# Altium schematic sheet SheetPowr.SchDoc: ?
size A3; Organization: VGTU; Address1: Elektronikos fakultetas; Address2: Kompiuterių inžinerijos katedra; Address3: Naugarduko 41; Address4: Vilnius, Lietuva; Revision: ?; SheetNumber: ?; SheetTotal: ?
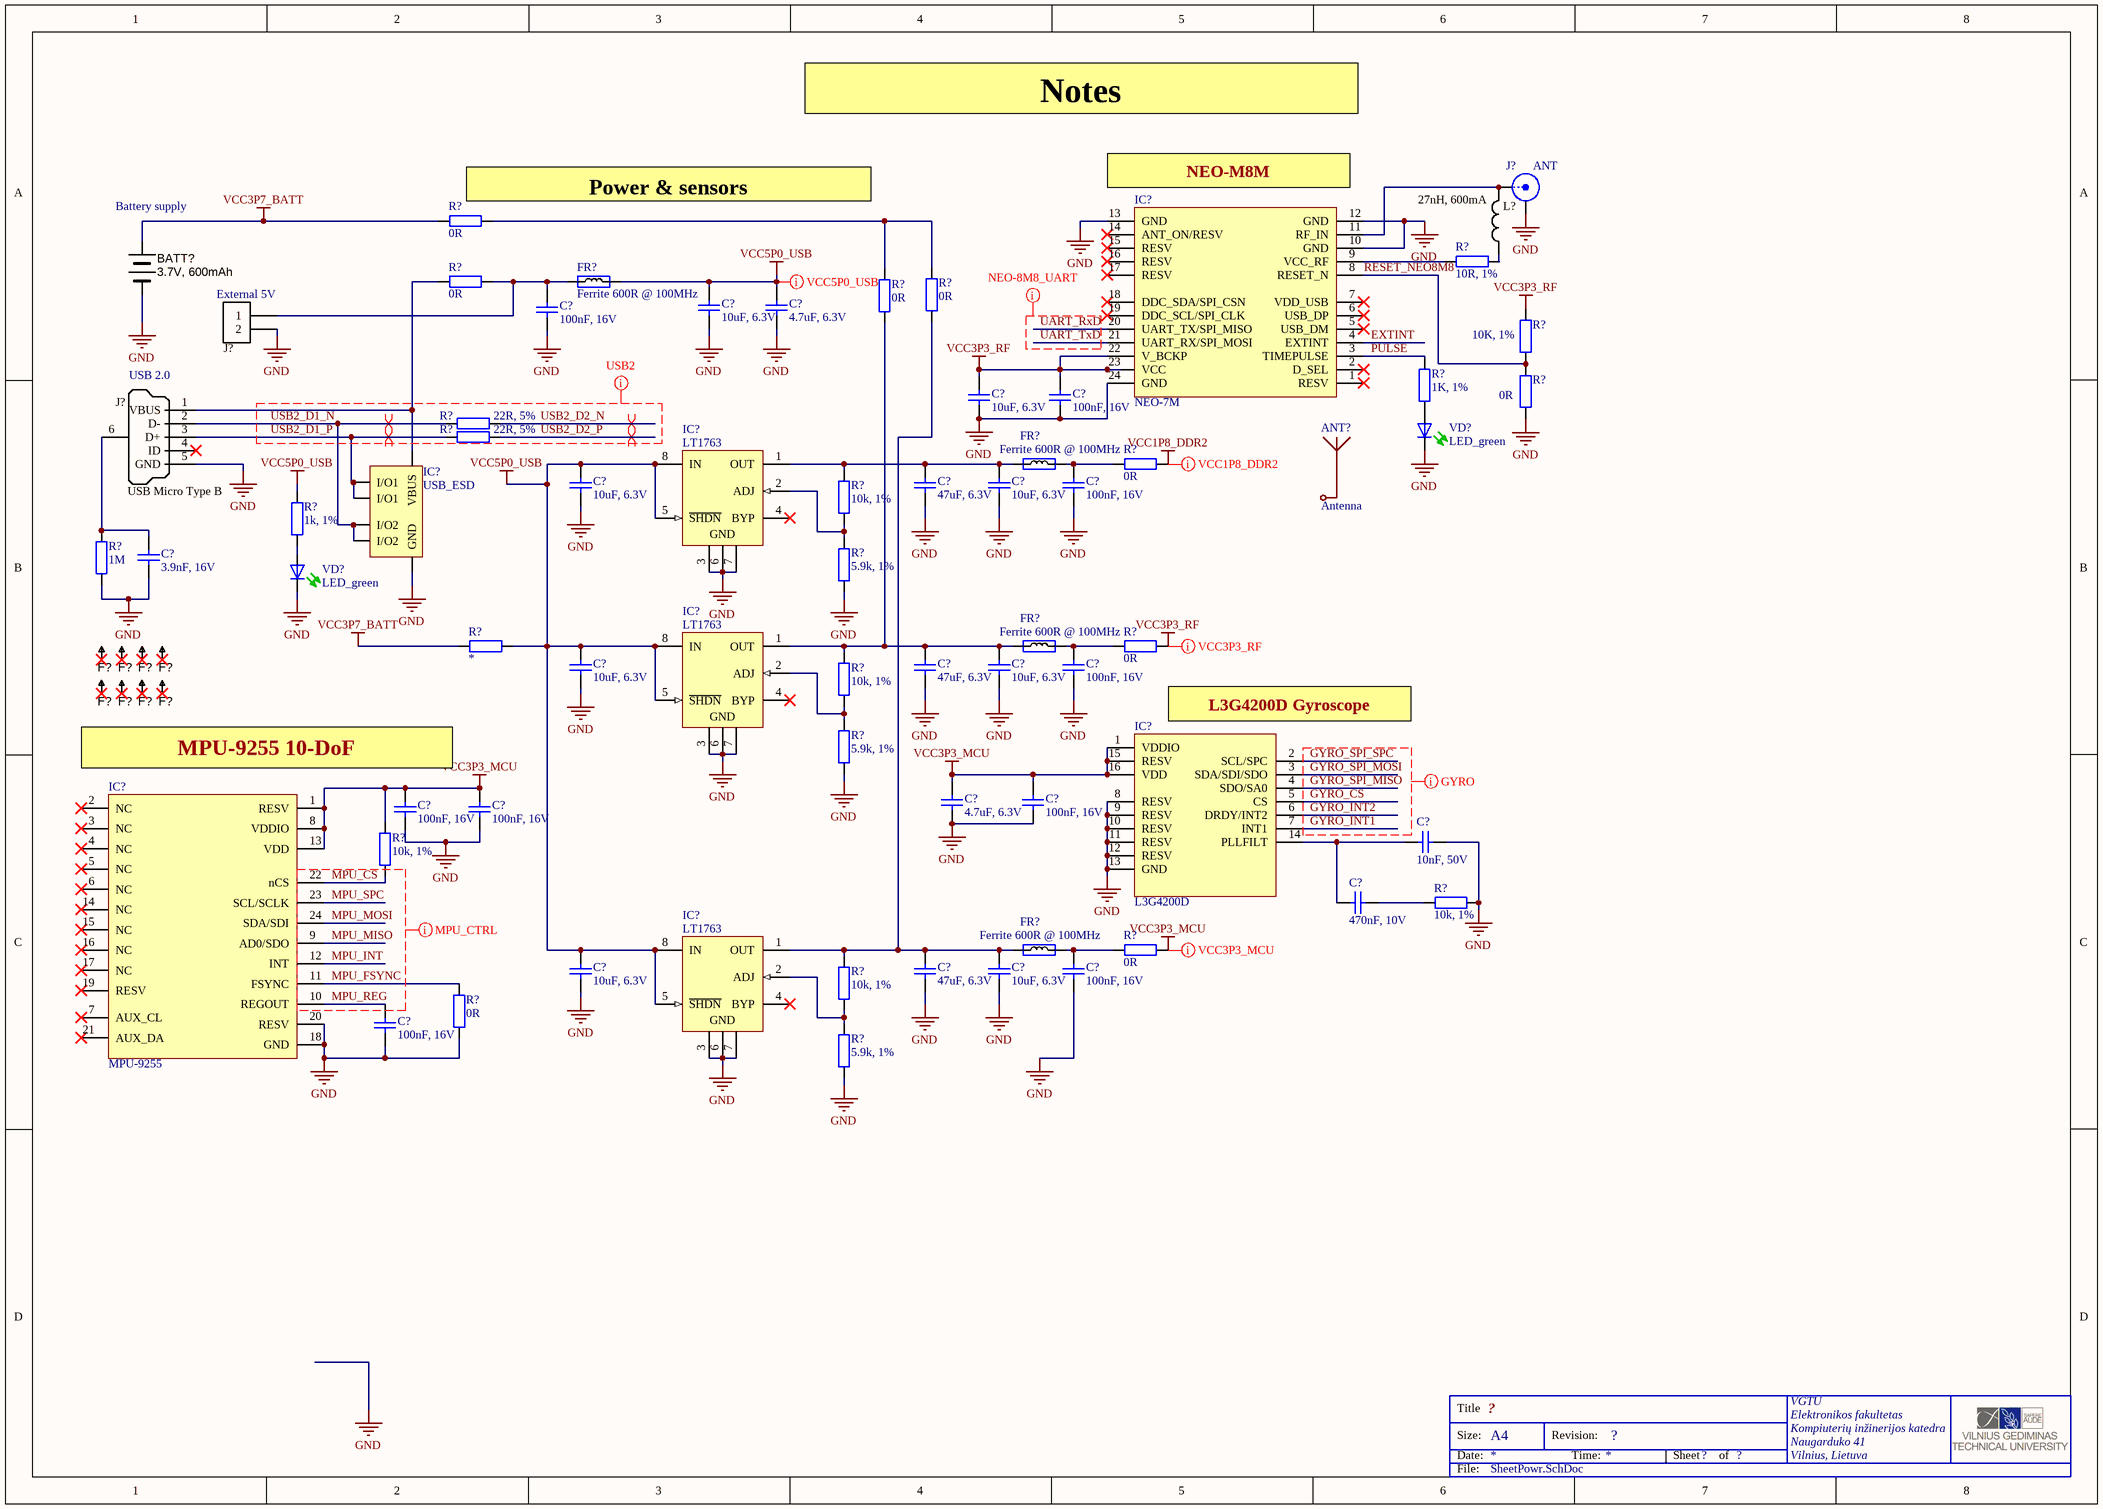
[diagram p0: SheetPowr.SchDoc]

## Parts
(Parts that share a designator on the sheet are numbered #1, #2 ... from top to bottom, then left to right.)
ANT?  Antenna  (mechanical)
BATT?  3.7V, 600mAh  (no BOM)
C?#1  100nF, 16V  [CAP0402]
C?#2  10uF, 6.3V  [CAP0402]
C?#3  4.7uF, 6.3V  [CAP0402]
C?#4  10uF, 6.3V  [CAP0402]
C?#5  100nF, 16V  [CAP0402]
C?#6  10uF, 6.3V  [CAP0402]
C?#7  47uF, 6.3V  [CAP0402]
C?#8  10uF, 6.3V  [CAP0402]
C?#9  100nF, 16V  [CAP0402]
C?#10  3.9nF, 16V  [CAP0402]
C?#11  10uF, 6.3V  [CAP0402]
C?#12  47uF, 6.3V  [CAP0402]
C?#13  10uF, 6.3V  [CAP0402]
C?#14  100nF, 16V  [CAP0402]
C?#15  4.7uF, 6.3V  [CAP0402]
C?#16  100nF, 16V  [CAP0402]
C?#17  100nF, 16V  [CAP0402]
C?#18  100nF, 16V  [CAP0402]
C?#19  10nF, 50V  [CAP0402]
C?#20  470nF, 10V  [CAP0402]
C?#21  10uF, 6.3V  [CAP0402]
C?#22  47uF, 6.3V  [CAP0402]
C?#23  10uF, 6.3V  [CAP0402]
C?#24  100nF, 16V  [CAP0402]
C?#25  100nF, 16V  [CAP0402]
F?#1  Fiducial  [Fiducial]  (value not drawn)  (no BOM)
F?#2  Fiducial  [Fiducial]  (value not drawn)  (no BOM)
F?#3  Fiducial  [Fiducial]  (value not drawn)  (no BOM)
F?#4  Fiducial  [Fiducial]  (value not drawn)  (no BOM)
F?#5  Fiducial  [Fiducial]  (value not drawn)  (no BOM)
F?#6  Fiducial  [Fiducial]  (value not drawn)  (no BOM)
F?#7  Fiducial  [Fiducial]  (value not drawn)  (no BOM)
F?#8  Fiducial  [Fiducial]  (value not drawn)  (no BOM)
FR?#1  Ferrite 600R @ 100MHz  [RES0402]
FR?#2  Ferrite 600R @ 100MHz  [RES0402]
FR?#3  Ferrite 600R @ 100MHz  [RES0402]
FR?#4  Ferrite 600R @ 100MHz  [RES0402]
IC?#1  NEO-7M
IC?#2  LT1763  [LT-S8-8_M]
IC?#3  USB_ESD  [USBULC6]
IC?#4  LT1763  [LT-S8-8_M]
IC?#5  L3G4200D
IC?#6  MPU-9255
IC?#7  LT1763  [LT-S8-8_M]
J?#1  ANT  [MMCX_conn]
J?#2  Header 2x1 pin  (value not drawn)
J?#3  USB Micro Type B  [microUSB]
L?  27nH, 600mA
R?#1  0R  [RES0402]
R?#2  10R, 1%  [RES0402]
R?#3  0R  [RES0402]
R?#4  0R  [RES0402]
R?#5  0R  [RES0402]
R?#6  10K, 1%  [RES0402]
R?#7  1K, 1%  [RES0402]
R?#8  0R  [RES0402]
R?#9  22R, 5%  [RES0402]
R?#10  22R, 5%  [RES0402]
R?#11  0R  [RES0402]
R?#12  10k, 1%  [RES0402]
R?#13  1k, 1%  [RES0402]
R?#14  1M  [RES0402]
R?#15  5.9k, 1%  [RES0402]
R?#16  *  [RES0402]
R?#17  0R  [RES0402]
R?#18  10k, 1%  [RES0402]
R?#19  5.9k, 1%  [RES0402]
R?#20  10k, 1%  [RES0402]
R?#21  10k, 1%  [RES0402]
R?#22  0R  [RES0402]
R?#23  10k, 1%  [RES0402]
R?#24  0R  [RES0402]
R?#25  5.9k, 1%  [RES0402]
VD?#1  LED_green  [LED-0603-GREEN]
VD?#2  LED_green  [LED-0603-GREEN]

## Nets
GND: BATT?.2 C?#1.1 C?#2.1 C?#3.1 C?#4.1 C?#5.1 C?#6.1 C?#7.1 C?#8.1 C?#9.1 C?#10.1 C?#11.1 C?#12.1 C?#13.1 C?#14.1 C?#15.1 C?#16.1 C?#17.2 C?#18.2 C?#19.1 C?#21.1 C?#22.1 C?#23.1 C?#24.1 C?#25.2 IC?#1.10(GND) IC?#1.12(GND) IC?#1.13(GND) IC?#1.24(GND) IC?#2.3(GND) IC?#2.6(GND) IC?#2.7(GND) IC?#3.2(GND) IC?#4.3(GND) IC?#4.6(GND) IC?#4.7(GND) IC?#5.8(RESV) IC?#5.9(RESV) IC?#5.10(RESV) IC?#5.11(RESV) IC?#5.12(RESV) IC?#5.13(GND) IC?#6.18(GND) IC?#6.20(RESV) IC?#7.3(GND) IC?#7.6(GND) IC?#7.7(GND) J?#1.2(Y) J?#2.2 J?#3.5(GND) R?#8.2 R?#14.1 R?#15.1 R?#19.1 R?#21.1 R?#24.2 R?#25.1 VD?#1.K(C) VD?#2.K(C)
VCC1P8_DDR2: R?#11.1
VCC3P3_MCU: C?#15.2 C?#16.2 C?#17.1 C?#18.1 IC?#5.1(VDDIO) IC?#5.15(RESV) IC?#5.16(VDD) IC?#6.1(RESV) IC?#6.8(VDDIO) IC?#6.13(VDD) R?#20.1 R?#22.1
VCC3P3_RF: C?#4.2 C?#5.2 IC?#1.22(V_BCKP) IC?#1.23(VCC) R?#6.2 R?#17.1
VCC3P7_BATT: BATT?.1 R?#1.1 R?#16.1
VCC5P0_USB: C?#2.2 C?#3.2 C?#6.2 C?#11.2 C?#21.2 FR?#1.2 IC?#2.5(~{SHDN}) IC?#2.8(IN) IC?#4.5(~{SHDN}) IC?#4.8(IN) IC?#7.5(~{SHDN}) IC?#7.8(IN) R?#13.2 R?#16.2
EXTINT: IC?#1.4(EXTINT)
GYRO_CS: IC?#5.5(CS)
GYRO_INT1: IC?#5.7(INT1)
GYRO_INT2: IC?#5.6(DRDY/INT2)
GYRO_SPI_MISO: IC?#5.4(SDO/SA0)
GYRO_SPI_MOSI: IC?#5.3(SDA/SDI/SDO)
GYRO_SPI_SPC: IC?#5.2(SCL/SPC)
MPU_CS: IC?#6.22(nCS) R?#20.2
MPU_FSYNC: IC?#6.11(FSYNC) R?#24.1
MPU_INT: IC?#6.12(INT)
MPU_MISO: IC?#6.9(AD0/SDO)
MPU_MOSI: IC?#6.24(SDA/SDI)
MPU_REG: C?#25.1 IC?#6.10(REGOUT)
MPU_SPC: IC?#6.23(SCL/SCLK)
PULSE: IC?#1.3(TIMEPULSE) R?#7.2
RESET_NEO8M8: IC?#1.8(RESET_N) R?#6.1 R?#8.1
UART_RxD: IC?#1.20(UART_TX/SPI_MISO)
UART_TxD: IC?#1.21(UART_RX/SPI_MOSI)
USB2_D1_N: IC?#3.3(I/O2) IC?#3.4(I/O2) J?#3.2(D-) R?#9.1
USB2_D1_P: IC?#3.1(I/O1) IC?#3.6(I/O1) J?#3.3(D+) R?#10.1
USB2_D2_N: R?#9.2
USB2_D2_P: R?#10.2
NetC?#1_2: C?#1.2 FR?#1.1 J?#2.1 R?#3.2
NetC?#7_2: C?#7.2 C?#8.2 FR?#2.1 IC?#2.1(OUT) R?#12.2
NetC?#9_2: C?#9.2 FR?#2.2 R?#11.2
NetC?#10_2: C?#10.2 J?#3.6(Shell) R?#14.2
NetC?#12_2: C?#12.2 C?#13.2 FR?#3.1 IC?#4.1(OUT) R?#4.1 R?#18.2
NetC?#14_2: C?#14.2 FR?#3.2 R?#17.2
NetC?#19_2: C?#19.2 C?#20.2 IC?#5.14(PLLFILT)
NetC?#20_1: C?#20.1 R?#21.2
NetC?#22_2: C?#22.2 C?#23.2 FR?#4.1 IC?#7.1(OUT) R?#5.1 R?#23.2
NetC?#24_2: C?#24.2 FR?#4.2 R?#22.2
NetIC?#1_9: IC?#1.9(VCC_RF) R?#2.1
NetIC?#1_11: IC?#1.11(RF_IN) J?#1.1(X) L?.2
NetIC?#2_2: IC?#2.2(ADJ) R?#12.1 R?#15.2
NetIC?#3_5: IC?#3.5(VBUS) J?#3.1(VBUS) R?#3.1
NetIC?#4_2: IC?#4.2(ADJ) R?#18.1 R?#19.2
NetIC?#7_2: IC?#7.2(ADJ) R?#23.1 R?#25.2
NetL?_1: L?.1 R?#2.2
NetR?#1_2: R?#1.2 R?#4.2 R?#5.2
NetR?#7_1: R?#7.1 VD?#1.A
NetR?#13_1: R?#13.1 VD?#2.A

Not connected (* = marked no-connect by the designer): F?#1 1*; F?#2 1*; F?#3 1*; F?#4 1*; F?#5 1*; F?#6 1*; F?#7 1*; F?#8 1*; IC?#1 1(RESV)* 2(D_SEL)* 5(USB_DM)* 6(USB_DP)* 7(VDD_USB)* 14(ANT_ON/RESV)* 15(RESV)* 16(RESV)* 17(RESV)* 18(DDC_SDA/SPI_CSN)* 19(DDC_SCL/SPI_CLK)*; IC?#2 4(BYP)*; IC?#4 4(BYP)*; IC?#6 2(NC)* 3(NC)* 4(NC)* 5(NC)* 6(NC)* 7(AUX_CL)* 14(NC)* 15(NC)* 16(NC)* 17(NC)* 19(RESV)* 21(AUX_DA)*; IC?#7 4(BYP)*; J?#3 4(ID)*

## Layout directives
differential pair: USB2_D1_N, USB2_D1_P, USB2_D2_N, USB2_D2_P
mark named VCC1P8_DDR2: VCC1P8_DDR2
mark named VCC3P3_RF: VCC3P3_RF
mark named VCC3P3_MCU: VCC3P3_MCU
mark named USB2: USB2_D1_N, USB2_D1_P, USB2_D2_N, USB2_D2_P
mark named VCC5P0_USB: VCC5P0_USB
mark named MPU_CTRL: MPU_CS, MPU_FSYNC, MPU_INT, MPU_MISO, MPU_MOSI, MPU_REG, MPU_SPC
mark named GYRO: GYRO_CS, GYRO_INT1, GYRO_INT2, GYRO_SPI_MISO, GYRO_SPI_MOSI, GYRO_SPI_SPC
mark named NEO-8M8_UART: UART_RxD, UART_TxD

## Notes on the sheet
- Notes
- (near IC?#1) NEO-M8M
- (near BATT?) Battery supply
- (near R?#1) Power & sensors
- (near J?#2) External 5V
- (near J?#3) USB 2.0
- L3G4200D Gyroscope
- MPU-9255 10-DoF
- Title
- Size:
- Date:
- A4
- Revision:
- Time:
- Sheet
- of
- File:

## Library data of the parts
BATT? = BATT: 42.5 x 25.7 x 6.5 mm 3.7 V 600 mAh Rechargeable Lithium Ion Polymer Battery Pack; Manufacturer: Renata; Manufacturer Part Number: ICP622540PMT; Approvals: IEC; Max Charge Current: 300mA; Number of Batteries: 1; Output Current: 600mA; Supplier: Mouser; Supplier Part Number: 614-ICP622540PMT; Category: Batteries and Accessories; Stock: 513; Pricing: 1=14.08, 10=11.74, 50=10.3, 100=9.75, 1000=9.72, 10000=9.72 (USD); Case/Package: 600; Chemistry/Technology: Lithium; Country of Origin: Switzerland; Export Control Classification Number (ECCN) Code: 3A991.J.2; Height: 6.5mm; Harmonized Tariff Schedule (HTS) Code: 8507.80.82.00; Introduction Date: 2018-12-20; Lead Free: Lead Free; Length: 42.5mm; Lifecycle Status: Production; Max Operating Temperature: 60°C; Min Operating Temperature: -20°C; Output Voltage: 3.7V; REACH SVHC: No; Termination: Wire; Voltage: 3.7V; Weight: 11g; Width: 25.7mm; ComponentLink1URL: https://datasheet.octopart.com:443/ICP622540PMT-Renata-datasheet-181185937.pdf?src-supplier=IHS; ComponentLink1Description: https://datasheet.octopart.com:443/ICP622540PMT-Renata-datasheet-181185937.pdf?src-supplier=IHS; ComponentLink2URL: https://datasheet.octopart.com:443/ICP622540PMT-Renata-datasheet-145014577.pdf?src-supplier=Future+Electronics; ComponentLink2Description: https://datasheet.octopart.com:443/ICP622540PMT-Renata-datasheet-145014577.pdf?src-supplier=Future+Electronics; ComponentLink3URL: https://datasheet.octopart.com:443/ICP622540PMT-Renata-datasheet-62059859.pdf?src-supplier=Future+Electronics; ComponentLink3Description: https://datasheet.octopart.com:443/ICP622540PMT-Renata-datasheet-62059859.pdf?src-supplier=Future+Electronics
C?#1-C?#25 = Cap: Value: *
FR?#1 = Ferrite: Ferrite Beads Multi-Layer 600Ohm 25% 100MHz 500mA 380mOhm DCR 0603 Automotive Paper T/R; Manufacturer: Murata; Manufacturer Part Number: BLM18AG601SN1D; DC Resistance (DCR): 380mΩ; Impedance: 600Ω; Number of Circuits: 1; Value: 380mΩ; Shielding: Unshielded; Supplier: Farnell; Supplier Part Number: BLM18AG601SN1D; RoHS: Compliant; Category: Ferrite Beads and Chips; Stock: 230013; Pricing: 10=0.0535, 100=0.0382, 500=0.0296, 1000=0.0258, 2000=0.023, 4000=0.0201 (EUR); Case/Package: 0603; Case Code (Imperial): 0603; Case Code (Metric): 1608; Core Material: Ferrite; Country of Origin: Japan, Thailand; Current Rating: 500mA; DC Current: 500mA; Depth: 800µm; Export Control Classification Number (ECCN) Code: EAR99; Frequency: 100MHz; Height: 800µm; Harmonized Tariff Schedule (HTS) Code: 8504.50.80.00; Introduction Date: 2001-08-28; Lead Free: Lead Free; Length: 1.6mm; Lifecycle Status: Production; Material: Ferrite, Steel; Max Current Rating: 500mA; Max DC Current: 500mA; Clock Frequency: 100MHz; Max Operating Temperature: 125°C; Military Standard: Not; Min Operating Temperature: -55°C; Mounting Technology: Surface Mount; Number of Lines: 1; Pins: 2; Number of Terminals: 2; Packaging: Cut Tape; Radiation Hardening: No; REACH SVHC: Yes; RMS Current (Irms): 500mA; Schedule B: 8543706000, 8543706000|8543706000, 8543706000|8543706000|8543706000, 8543706000|8543706000|8543706000|8543706000; ESR: 380mΩ; Termination: SMD/SMT; Test Frequency: 100MHz; Tolerance: 25%; Weight: 2.012816mg; Width: 800µm; ComponentLink1URL: https://datasheet.octopart.com:443/BLM18AG601SN1D-Murata-datasheet-180806579.pdf?src-supplier=IHS; ComponentLink1Description: https://datasheet.octopart.com:443/BLM18AG601SN1D-Murata-datasheet-180806579.pdf?src-supplier=IHS; ComponentLink2URL: https://datasheet.octopart.com:443/BLM18AG601SN1D-Murata-datasheet-41195.pdf?src-supplier=Upverter; ComponentLink2Description: https://datasheet.octopart.com:443/BLM18AG601SN1D-Murata-datasheet-41195.pdf?src-supplier=Upverter; ComponentLink3URL: https://datasheet.octopart.com:443/BLM18AG601SN1D-Murata-datasheet-11743096.pdf?src-supplier=Newark; ComponentLink3Description: https://datasheet.octopart.com:443/BLM18AG601SN1D-Murata-datasheet-11743096.pdf?src-supplier=Newark; ComponentLink4URL: https://datasheet.octopart.com:443/BLM18AG601SN1D-Murata-datasheet-5338592.pdf?src-supplier=Newark; ComponentLink4Description: https://datasheet.octopart.com:443/BLM18AG601SN1D-Murata-datasheet-5338592.pdf?src-supplier=Newark; ComponentLink5URL: https://datasheet.octopart.com:443/BLM18AG601SN1D-Murata-datasheet-511221.pdf?src-supplier=TME; ComponentLink5Description: https://datasheet.octopart.com:443/BLM18AG601SN1D-Murata-datasheet-511221.pdf?src-supplier=TME; ComponentLink6URL: https://datasheet.octopart.com:443/BLM18AG601SN1D-Murata-datasheet-135086656.pdf?src-supplier=TME; ComponentLink6Description: https://datasheet.octopart.com:443/BLM18AG601SN1D-Murata-datasheet-135086656.pdf?src-supplier=TME; ComponentLink7URL: https://datasheet.octopart.com:443/BLM18AG601SN1D-Murata-datasheet-5396529.pdf?src-supplier=Factory+Futures; ComponentLink7Description: https://datasheet.octopart.com:443/BLM18AG601SN1D-Murata-datasheet-5396529.pdf?src-supplier=Factory+Futures; ComponentLink8URL: https://datasheet.octopart.com:443/BLM18AG601SN1D-Murata-datasheet-141257898.pdf?src-supplier=Ciiva; ComponentLink8Description: https://datasheet.octopart.com:443/BLM18AG601SN1D-Murata-datasheet-141257898.pdf?src-supplier=Ciiva; ComponentLink9URL: https://datasheet.octopart.com:443/BLM18AG601SN1D-Murata-datasheet-138706784.pdf?src-supplier=Ciiva; ComponentLink9Description: https://datasheet.octopart.com:443/BLM18AG601SN1D-Murata-datasheet-138706784.pdf?src-supplier=Ciiva; ComponentLink10URL: https://datasheet.octopart.com:443/BLM18AG601SN1D-Murata-datasheet-78375072.pdf?src-supplier=Future+Electronics; ComponentLink10Description: https://datasheet.octopart.com:443/BLM18AG601SN1D-Murata-datasheet-78375072.pdf?src-supplier=Future+Electronics; ComponentLink11URL: https://datasheet.octopart.com:443/BLM18AG601SN1D-Murata-datasheet-58177255.pdf?src-supplier=Future+Electronics; ComponentLink11Description: https://datasheet.octopart.com:443/BLM18AG601SN1D-Murata-datasheet-58177255.pdf?src-supplier=Future+Electronics; ComponentLink12URL: https://datasheet.octopart.com/BLM18AG601SN1D-Murata-datasheet-37129980.pdf; ComponentLink12Description: https://datasheet.octopart.com/BLM18AG601SN1D-Murata-datasheet-37129980.pdf; ComponentLink13URL: https://datasheet.octopart.com:443/BLM18AG601SN1D-Murata-datasheet-14066397.pdf?src-supplier=iiiC; ComponentLink13Description: https://datasheet.octopart.com:443/BLM18AG601SN1D-Murata-datasheet-14066397.pdf?src-supplier=iiiC; ComponentLink14URL: https://datasheet.octopart.com:443/BLM18AG601SN1D-Murata-datasheet-9604654.pdf?src-supplier=RS+(Formerly+Allied+Electronics); ComponentLink14Description: https://datasheet.octopart.com:443/BLM18AG601SN1D-Murata-datasheet-9604654.pdf?src-supplier=RS+(Formerly+Allied+Electronics); ComponentLink15URL: https://datasheet.octopart.com:443/BLM18AG601SN1D-Murata-datasheet-13143.pdf?src-supplier=RS+(Formerly+Allied+Electronics); ComponentLink15Description: https://datasheet.octopart.com:443/BLM18AG601SN1D-Murata-datasheet-13143.pdf?src-supplier=RS+(Formerly+Allied+Electronics); ComponentLink16URL: https://datasheet.octopart.com:443/BLM18AG601SN1D-Murata-datasheet-7628479.pdf?src-supplier=Jameco; ComponentLink16Description: https://datasheet.octopart.com:443/BLM18AG601SN1D-Murata-datasheet-7628479.pdf?src-supplier=Jameco; ComponentLink17URL: https://datasheet.octopart.com:443/BLM18AG601SN1D-Murata-datasheet-11030792.pdf?src-supplier=Farnell; ComponentLink17Description: https://datasheet.octopart.com:443/BLM18AG601SN1D-Murata-datasheet-11030792.pdf?src-supplier=Farnell; ComponentLink18URL: http://sigma.octopart.com:80/reach_statement/Murata-company-16.pdf?src-supplier=Compliance+Statements; ComponentLink18Description: http://sigma.octopart.com:80/reach_statement/Murata-company-16.pdf?src-supplier=Compliance+Statements
FR?#2-FR?#4 = Ferrite
IC?#1 = NEO-7M: GNSS engine for GPS/QZSS, GLONASS; Manufacturer: U-blox; DatasheetVersion: R07 11-Nov-2014; PackageDescription: NEO-7 series 12.2 x 16 x 2.4 mm; ComponentLink1URL: https://www.u-blox.com/en/product/neo-7-series; ComponentLink2Description: Datasheet; ComponentLink1Description: https://www.u-blox.com/en/product/neo-7-series
IC?#2 IC?#4 IC?#7 = LT1763MPS8: 500 mA, Low Noise, LDO Micropower Regulator, 1.8 to 20 V Vin, Adjustable Vout, 8-pin SOIC (S8-8), -55 to 125 degC; Manufacturer: Linear Technology; Discrete Pass Element: no; Dropout Voltage(V): 0.3; Iout(mA): 500; Isupply(mA): 0.03; Noise(uV): 20; Number of Outputs: 1; Output Voltage: Adj; PSRR(dB): 65; Vin Min(V): 1.8; Vout Min(V): 1.22; DatasheetVersion: Rev. G; PackageVersion: Rev. G, 03/2012; PackageReference: S8-8; PackageDescription: 8-Pin Plastic Small Outline (Narrow .150 Inch), Body 4.9 x 3.9 mm, Pitch 1.27 mm; Supplier 1: Newark; Supplier Part Number 1: 57M6069; RoHS: FALSE; Shutdown Current(uA): 1; Vin Max(V): 20; Vout Max(V): 20; Mounting Technology: Surface Mount; PartNumber: LT1763MPS8; ComponentLink1Description: Manufacturer URL; ComponentLink1URL: http://www.linear.com/; ComponentLink2Description: Datasheet; ComponentLink2URL: http://cds.linear.com/docs/en/datasheet/1763fg.pdf; ComponentLink3Description: Package Specification; ComponentLink3URL: http://cds.linear.com/docs/en/packaging/05081610_G_SO8.pdf
IC?#3 = USBULC6-2P6: Manufacturer: STMicroelectronics; Current - Peak Pulse (10/1000µs): 5A (8/20µs); Capacitance @ Frequency: 1pF @ 1MHz; Bidirectional Channels: 2; Voltage - Reverse Standoff (Typ): 5V; Voltage - Breakdown (Min): 6V; Power Line Protection: Yes; Voltage - Clamping (Max) @ Ipp: 17V; Supplier 1: Digi-Key; Unidirectional Channels: -; Mounting Type: Surface Mount; Applications: Ethernet; Manufacturer Part Number 1: USBULC6-2P6; Type: Steering (Rail to Rail); Power - Peak Pulse: -; Category: Circuit Protection; Supplier Device Package: SOT-666; Package / Case: SOT-563, SOT-666; Packaging: Cut Tape (CT); Operating Temperature: -; RoHS: RoHS Compliant; Supplier Part Number 1: 497-15162-1-ND
IC?#5 = L3G4200D: MEMS motion sensor:  ultra-stable three-axis digital output gyroscope; Manufacturer: STMicroelectronics; DatasheetVersion: Doc ID 17116 Rev 3; PackageDescription: LGA-16 (4x4x1.1 mm); ComponentLink1URL: http://www.st.com/web/en/resource/technical/document/datasheet/CD00265057.pdf; ComponentLink2Description: Datasheet; ComponentLink1Description: http://www.st.com/web/en/resource/technical/document/datasheet/CD00265057.pdf
IC?#6 = MPU-9255: The MPU-9255 is a 3-axis gyroscope, 3-axis accelerometer, and 3-axis digital compass designed specifically for Automatic Activity Recognition library (AAR™) in a 3 x 3 mm package; Manufacturer: InvenSense; DatasheetVersion: Release Date: 09/14/2014; PackageDescription: 24-Pin 3X3X1 QFN; ComponentLink1URL: http://www.invensense.com/; ComponentLink2Description: Datasheet; ComponentLink2URL: http://43zrtwysvxb2gf29r5o0athu.wpengine.netdna-cdn.com/wp-content/uploads/2015/01/PS-MPU-92551.pdf; ComponentLink1Description: http://www.invensense.com/products/motion-tracking/9-axis/mpu-9255-2/
J?#1 = RF_IF_connector
J?#2 = Header2P: Header, 2-pin; Manufacturer Part Number 1: 961102-6404-AR; Manufacturer: 3M; Pitch: 0.100" (2.54mm); Connector Type: Header, Unshrouded; Number of Positions: 2; Number of Positions Loaded: All; Supplier 1: Digi-Key; Contact Mating Length: 0.217" (5.50mm); Mounting Type: Through Hole; Contact Finish: Gold; Color: Black; Termination: Solder; Fastening Type: -; Row Spacing: -; Features: -; Contact Finish Thickness: Flash; Number of Rows: 1; Category: Connectors, Interconnects; RoHS: RoHS Compliant; Contact Type: Male Pin; Packaging: Bulk; Supplier Part Number 1: 3M9447-ND
J?#3 = USB_Micro_TypeB: Connector SMD USB Micro Type B; Connector Type: USB - micro B; Number of Contacts: 5; Supplier 1: Digi-Key; Category: Connectors, Interconnects; Mounting Type: Surface Mount, Right Angle, Horizontal; Supplier Part Number 1: 609-4616-2-ND
L? = Inductor
R?#1-R?#25 = Res: Value: *
VD?#1 VD?#2 = LED_green: Light Emitting Diode/LED 0603 super bright Yellow green 568nm 12mcd paste; Manufacturer: Kingbright; Manufacturer Part Number: KPT-1608SGC; Forward Current: 25mA; Forward Voltage: 2.2V; Lens Color: Clear; Lens Style: Colorless, Diffused, Rectangular; Luminous Intensity: 15mcd; Max Junction Temperature (Tj): 110°C; Number of Circuits: 1; Peak Wavelength: 565nm; Power Dissipation: 62.5mW; Reverse Voltage: 5V; Shape: Rectangular; Viewing Angle: 120°; Supplier: Farnell; Supplier Part Number: KPT-1608SGC; RoHS: Compliant; Category: LEDs; Stock: 18000; Pricing: 2000=0.07, 6000=0.0686 (EUR); Case/Package: 0603; China RoHS: Compliant; Color: Green; Country of Origin: Mainland China; Dominant Wavelength: 568nm; Height: 750µm; Harmonized Tariff Schedule (HTS) Code: 8541.40.20.00; Introduction Date: 1999-05-04; Lifecycle Status: Production; Max Operating Temperature: 85°C; Min Operating Temperature: -40°C; Mounting Technology: Surface Mount; Number of LEDs: 1; Pins: 2; Number of Terminals: 2; Packaging: Cut Tape; Radiation Hardening: No; REACH SVHC: Yes; Terminal Pitch: 1.65mm; Wavelength: 568nm; ComponentLink1URL: https://datasheet.octopart.com:443/KPT-1608SGC-Kingbright-datasheet-180521090.pdf?src-supplier=IHS; ComponentLink1Description: https://datasheet.octopart.com:443/KPT-1608SGC-Kingbright-datasheet-180521090.pdf?src-supplier=IHS; ComponentLink2URL: https://datasheet.octopart.com:443/KPT-1608SGC-Kingbright-datasheet-180510520.pdf?src-supplier=IHS; ComponentLink2Description: https://datasheet.octopart.com:443/KPT-1608SGC-Kingbright-datasheet-180510520.pdf?src-supplier=IHS; ComponentLink3URL: https://datasheet.octopart.com:443/KPT-1608SGC-Kingbright-datasheet-138896655.pdf?src-supplier=Upverter; ComponentLink3Description: https://datasheet.octopart.com:443/KPT-1608SGC-Kingbright-datasheet-138896655.pdf?src-supplier=Upverter; ComponentLink4URL: https://datasheet.octopart.com:443/KPT-1608SGC-Kingbright-datasheet-62316560.pdf?src-supplier=element14+APAC; ComponentLink4Description: https://datasheet.octopart.com:443/KPT-1608SGC-Kingbright-datasheet-62316560.pdf?src-supplier=element14+APAC; ComponentLink5URL: https://datasheet.octopart.com:443/KPT-1608SGC-Kingbright-datasheet-10923609.pdf?src-supplier=element14+APAC; ComponentLink5Description: https://datasheet.octopart.com:443/KPT-1608SGC-Kingbright-datasheet-10923609.pdf?src-supplier=element14+APAC; ComponentLink6URL: https://datasheet.octopart.com:443/KPT-1608SGC-Kingbright-datasheet-133513926.pdf?src-supplier=TME; ComponentLink6Description: https://datasheet.octopart.com:443/KPT-1608SGC-Kingbright-datasheet-133513926.pdf?src-supplier=TME; ComponentLink7URL: https://datasheet.octopart.com:443/KPT-1608SGC-Kingbright-datasheet-104959244.pdf?src-supplier=TME; ComponentLink7Description: https://datasheet.octopart.com:443/KPT-1608SGC-Kingbright-datasheet-104959244.pdf?src-supplier=TME; ComponentLink8URL: https://datasheet.octopart.com:443/KPT-1608SGC-Kingbright-datasheet-8328416.pdf?src-supplier=Sager+Electronics; ComponentLink8Description: https://datasheet.octopart.com:443/KPT-1608SGC-Kingbright-datasheet-8328416.pdf?src-supplier=Sager+Electronics